# Altium schematic sheet BUZZER.SchDoc
size A4; SheetNumber: 8; SheetTotal: 9
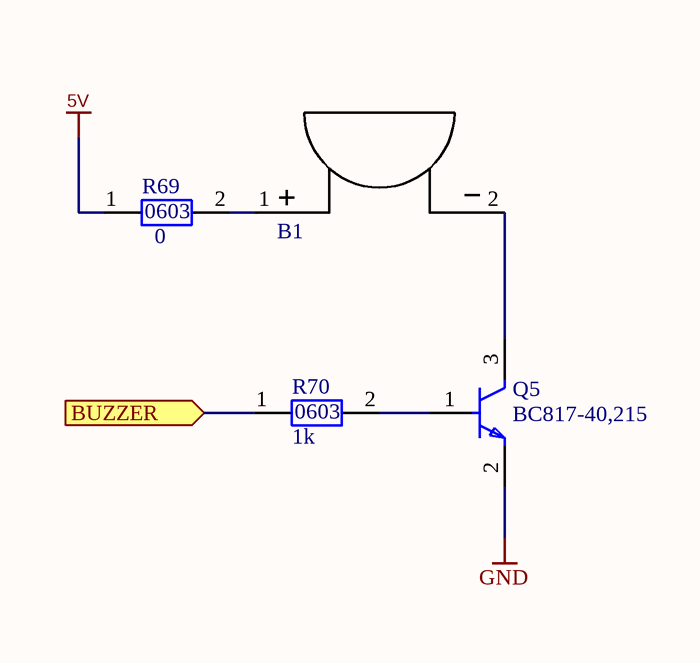
[diagram p0: BUZZER.SchDoc]

## Parts
B1  Buzzer  [Buzzer]  (value not drawn)
Q5  BC817-40,215  [FP-SOT23-MFG]
R69  SMD 0603 Resistor  [RESISTOR_SMD_0603]  (value not drawn)
R70  SMD 0603 Resistor  [RESISTOR_SMD_0603]  (value not drawn)

## Ports
BUZZER (in, see MAIN_SCHEMATIC[3C], STM32[2A])

## Nets
5V: R69.1
GND: Q5.2(E)
BUZZER: R70.1 ; port BUZZER
NetB1_1: B1.1 R69.2
NetB1_2: B1.2 Q5.3(C)
NetQ5_1: Q5.1(B) R70.2

## Notes on the sheet
- (near R69) 0
- (near R70) 1k
- (in symbol SMD 0603 Resistor) 0603

## Library data of the parts
B1 = Buzzer: 5V buzzer
Q5 = CMP-14406-000007-1: TRANS NPN 45V 0.5A SOT23; Manufacturer: Nexperia; Collector Emitter Saturation Voltage: 700mV; Power Dissipation: 250mW; Collector Base Voltage: 50V; Unity Gain Freq: 100MHz; Hfe Max: 600; Rthja Max: 500K/W; Emitter Base Voltage: 5V; Max Collector Current: 500mA; Hfe Testvce: 1V; Automotive Grade: Grade 0; Hfe Min: 250; Max Junction Temp: +150°C; Number Of Npn: 1; Hfe Testic: 100mA; Octopart: https://octopart.com/bc817-40%2C215-nexperia-78739081; Lead Free: Yes; Ipc Land Pattern Name: SOT95P230X100-3; Manufacturer Part Number: BC817-40,215; RoHS: TRUE; Collector Emitter Breakdown Voltage: 45V; Digikey Description: TRANS NPN 45V 0.5A SOT23; ComponentLink2URL: https://assets.nexperia.com/documents/data-sheet/BC817_SER.pdf; Temperature Range High: +150°C; Mouser Description: BC817 Series 45 V 500 mA 250 mW SMT NPN General-Purpose Transistor - SOT-23-; Device Class L3: BJTs; Temperature: to +150°C; Height: 1.1mm; Automotive: Yes; Ambient Temperature Range Low: -65°C; Package: SOT23; Collector Emitter Voltage: 45V; Category: Trans; ComponentLink2Description: Datasheet; Device Class L2: Transistors; Ambient Temperature Range High: +150°C; Number Of Elements: 1; Device Class L1: Discrete Semiconductors; Footprint Url: https://assets.nexperia.com/documents/outline-drawing/SOT23.pdf
R69 R70 = SMD 0603 Resistor: 0603 resistor